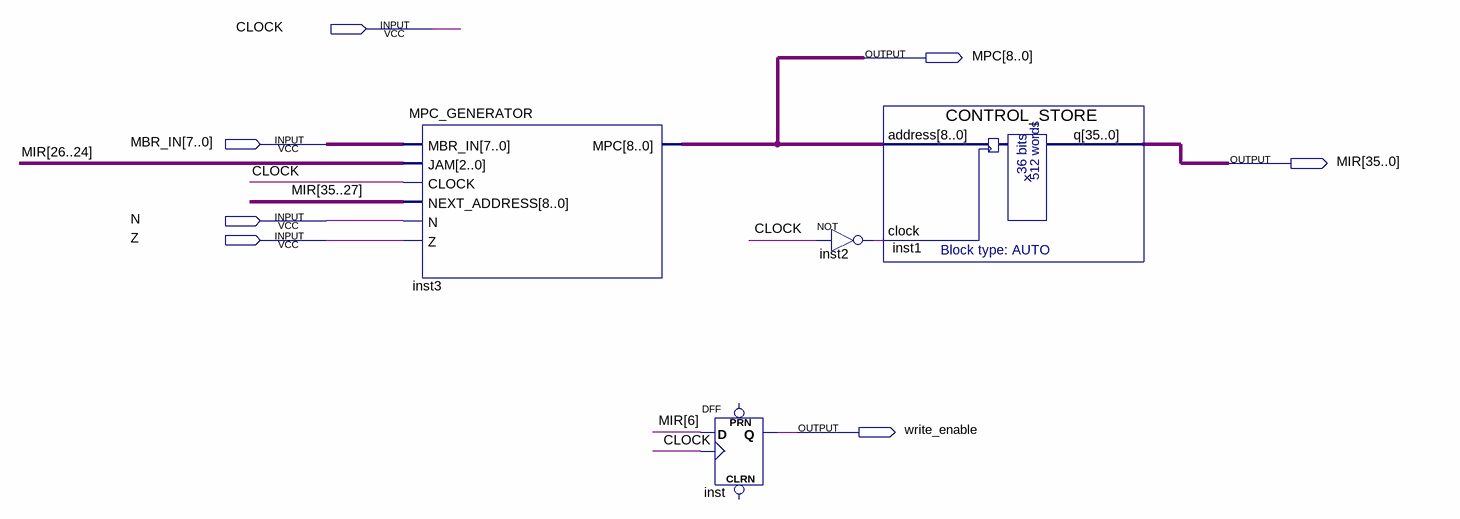
[diagram p0: schematic sheet]
// Quartus schematic CONTROL_UNIT.bdf as structural Verilog: 4 symbols, 7 pins
module CONTROL_UNIT (
  input  CLOCK,
  input  [7:0] MBR_IN,
  input  N,
  input  Z,
  output [8:0] MPC,
  output [35:0] MIR,
  output write_enable
);

  wire inst2_out;

  MPC_GENERATOR inst3 (
    .MBR_IN(MBR_IN), .JAM(MIR[26:24]), .CLOCK(CLOCK), .NEXT_ADDRESS(MIR[35:27]), .N(N), .Z(Z), .MPC(MPC));
  DFF inst (.CLK(CLOCK), .D(MIR[6]), .Q(write_enable));  // open: CLRN, PRN
  not inst2 (inst2_out, CLOCK);
  CONTROL_STORE inst1 (.address(MPC), .clock(inst2_out), .q(MIR));
endmodule
